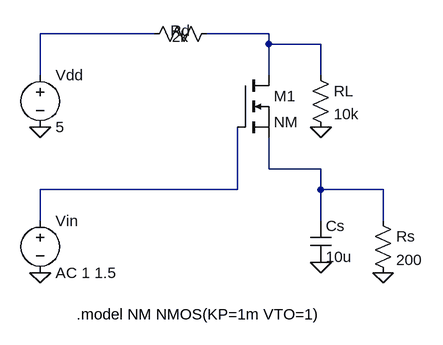
[diagram p0: schematic unseen_cs_amp.asc]
unseen_cs_amp.asc, the LTspice schematic file:
Version 4.1
SHEET 1 1600 1200
WIRE 288 64 288 16
WIRE 288 16 288 0
WIRE 288 0 192 0
WIRE 368 64 368 16
WIRE 368 16 288 16
WIRE 112 0 -64 0
WIRE -64 0 -64 64
WIRE 368 288 368 240
WIRE 368 240 368 208
WIRE 368 208 288 208
WIRE 288 208 288 160
WIRE 464 288 464 240
WIRE 464 240 368 240
WIRE 240 144 240 240
WIRE 240 240 -64 240
WIRE -64 240 -64 288
FLAG -64 144 0
FLAG -64 368 0
FLAG 464 368 0
FLAG 368 352 0
FLAG 368 144 0
SYMBOL nmos 240 64 R0
SYMATTR InstName M1
SYMATTR Value NM
SYMBOL res 96 16 R270
WINDOW 0 36 56 VBottom 2
WINDOW 3 -4 56 VTop 2
SYMATTR InstName Rd
SYMATTR Value 2k
SYMBOL cap 352 288 R0
SYMATTR InstName Cs
SYMATTR Value 10u
SYMBOL res 352 48 R0
SYMATTR InstName RL
SYMATTR Value 10k
SYMBOL res 448 272 R0
SYMATTR InstName Rs
SYMATTR Value 200
SYMBOL voltage -64 48 R0
SYMATTR InstName Vdd
SYMATTR Value 5
SYMBOL voltage -64 272 R0
SYMATTR InstName Vin
SYMATTR Value AC 1 1.5
TEXT -8 432 Left 2 !.model NM NMOS(KP=1m VTO=1)

The netlist it stands for:
* unseen_cs_amp.asc
M1 N001 N004 N003 N003 NM
Rd N002 N001 2k
Cs N003 0 10u
RL N001 0 10k
Rs N003 0 200
Vdd N002 0 5
Vin N004 0 AC 1 1.5
.model NMOS NMOS
.model PMOS PMOS
.lib standard.mos
.model NM NMOS(KP=1m VTO=1)
.backanno
.end